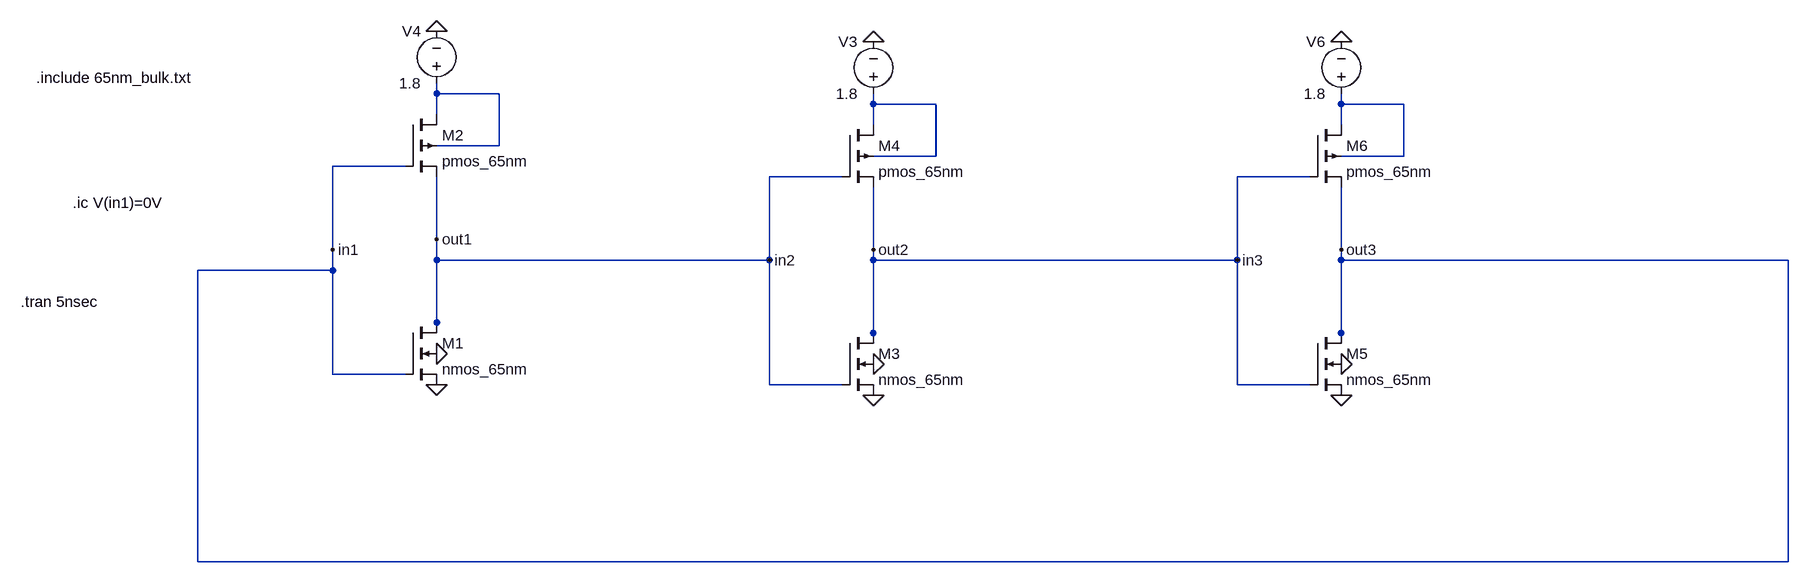
[diagram p0: schematic new_schematic_exp2.asc]
new_schematic_exp2.asc, the LTspice schematic file:
Version 4.1
SHEET 1 2132 680
WIRE 48 -224 48 -240
WIRE 144 -224 48 -224
WIRE 720 -208 720 -224
WIRE 816 -208 720 -208
WIRE 1440 -208 1440 -224
WIRE 1536 -208 1440 -208
WIRE 48 -192 48 -224
WIRE 720 -176 720 -208
WIRE 1440 -176 1440 -208
WIRE 144 -144 144 -224
WIRE 144 -144 48 -144
WIRE 816 -128 816 -208
WIRE 816 -128 720 -128
WIRE 1536 -128 1536 -208
WIRE 1536 -128 1440 -128
WIRE 0 -112 -112 -112
WIRE 672 -96 560 -96
WIRE 1392 -96 1280 -96
WIRE 48 0 48 -96
WIRE -112 16 -112 -112
WIRE 720 16 720 -80
WIRE 1440 16 1440 -80
WIRE 48 32 48 0
WIRE 560 32 560 -96
WIRE 560 32 48 32
WIRE 720 32 720 16
WIRE 1280 32 1280 -96
WIRE 1280 32 720 32
WIRE 1440 32 1440 16
WIRE 2128 32 1440 32
WIRE -112 48 -112 16
WIRE -112 48 -320 48
WIRE 48 128 48 32
WIRE 48 144 48 128
WIRE 720 144 720 32
WIRE 1440 144 1440 32
WIRE 720 160 720 144
WIRE 1440 160 1440 144
WIRE -112 208 -112 48
WIRE 0 208 -112 208
WIRE 560 224 560 32
WIRE 672 224 560 224
WIRE 1280 224 1280 32
WIRE 1392 224 1280 224
WIRE -320 496 -320 48
WIRE 2128 496 2128 32
WIRE 2128 496 -320 496
FLAG 48 224 0
FLAG 48 176 0
FLAG 48 -320 0
FLAG 48 0 out1
FLAG -112 16 in1
FLAG 720 240 0
FLAG 720 192 0
FLAG 720 -304 0
FLAG 720 16 out2
FLAG 560 32 in2
FLAG 1440 240 0
FLAG 1440 192 0
FLAG 1440 -304 0
FLAG 1440 16 out3
FLAG 1280 32 in3
SYMBOL nmos4 0 128 R0
SYMATTR InstName M1
SYMATTR Value nmos_65nm
SYMATTR Value2 l=100nm w=200nm
SYMBOL pmos4 0 -192 R0
SYMATTR InstName M2
SYMATTR Value pmos_65nm
SYMATTR Value2 l=100nm w=800nm
SYMBOL voltage 48 -224 R180
WINDOW 0 24 96 Left 2
WINDOW 3 24 16 Left 2
WINDOW 123 0 0 Left 0
WINDOW 39 0 0 Left 0
SYMATTR InstName V4
SYMATTR Value 1.8
SYMBOL nmos4 672 144 R0
SYMATTR InstName M3
SYMATTR Value nmos_65nm
SYMATTR Value2 l=100nm w=200nm
SYMBOL pmos4 672 -176 R0
SYMATTR InstName M4
SYMATTR Value pmos_65nm
SYMATTR Value2 l=100nm w=800nm
SYMBOL voltage 720 -208 R180
WINDOW 0 24 96 Left 2
WINDOW 3 24 16 Left 2
WINDOW 123 0 0 Left 0
WINDOW 39 0 0 Left 0
SYMATTR InstName V3
SYMATTR Value 1.8
SYMBOL nmos4 1392 144 R0
SYMATTR InstName M5
SYMATTR Value nmos_65nm
SYMATTR Value2 l=100nm w=200nm
SYMBOL pmos4 1392 -176 R0
SYMATTR InstName M6
SYMATTR Value pmos_65nm
SYMATTR Value2 l=100nm w=800nm
SYMBOL voltage 1440 -208 R180
WINDOW 0 24 96 Left 2
WINDOW 3 24 16 Left 2
WINDOW 123 0 0 Left 0
WINDOW 39 0 0 Left 0
SYMATTR InstName V6
SYMATTR Value 1.8
TEXT -568 -248 Left 2 !.include 65nm_bulk.txt
TEXT -512 -56 Left 2 !.ic V(in1)=0V
TEXT -592 96 Left 2 !.tran 5nsec

The netlist it stands for:
* new_schematic_exp2.asc
M1 in2 out3 0 0 nmos_65nm l=100nm w=200nm
M2 N001 out3 in2 N001 pmos_65nm l=100nm w=800nm
V4 N001 0 1.8
M3 in3 in2 0 0 nmos_65nm l=100nm w=200nm
M4 N002 in2 in3 N002 pmos_65nm l=100nm w=800nm
V3 N002 0 1.8
M5 out3 in3 0 0 nmos_65nm l=100nm w=200nm
M6 N003 in3 out3 N003 pmos_65nm l=100nm w=800nm
V6 N003 0 1.8
.model NMOS NMOS
.model PMOS PMOS
.lib standard.mos
.include 65nm_bulk.txt
.ic V(in1)=0V
.tran 5nsec
.backanno
.end